# EasyEDA Pro project energymonitor_2025-05-27.epro, schematic Schematic_1, sheets 4 to 6 of 6

## Sheets
4 P4: Create Date: 2025-04-22; Page Name: P4; Update Date: 2025-04-23
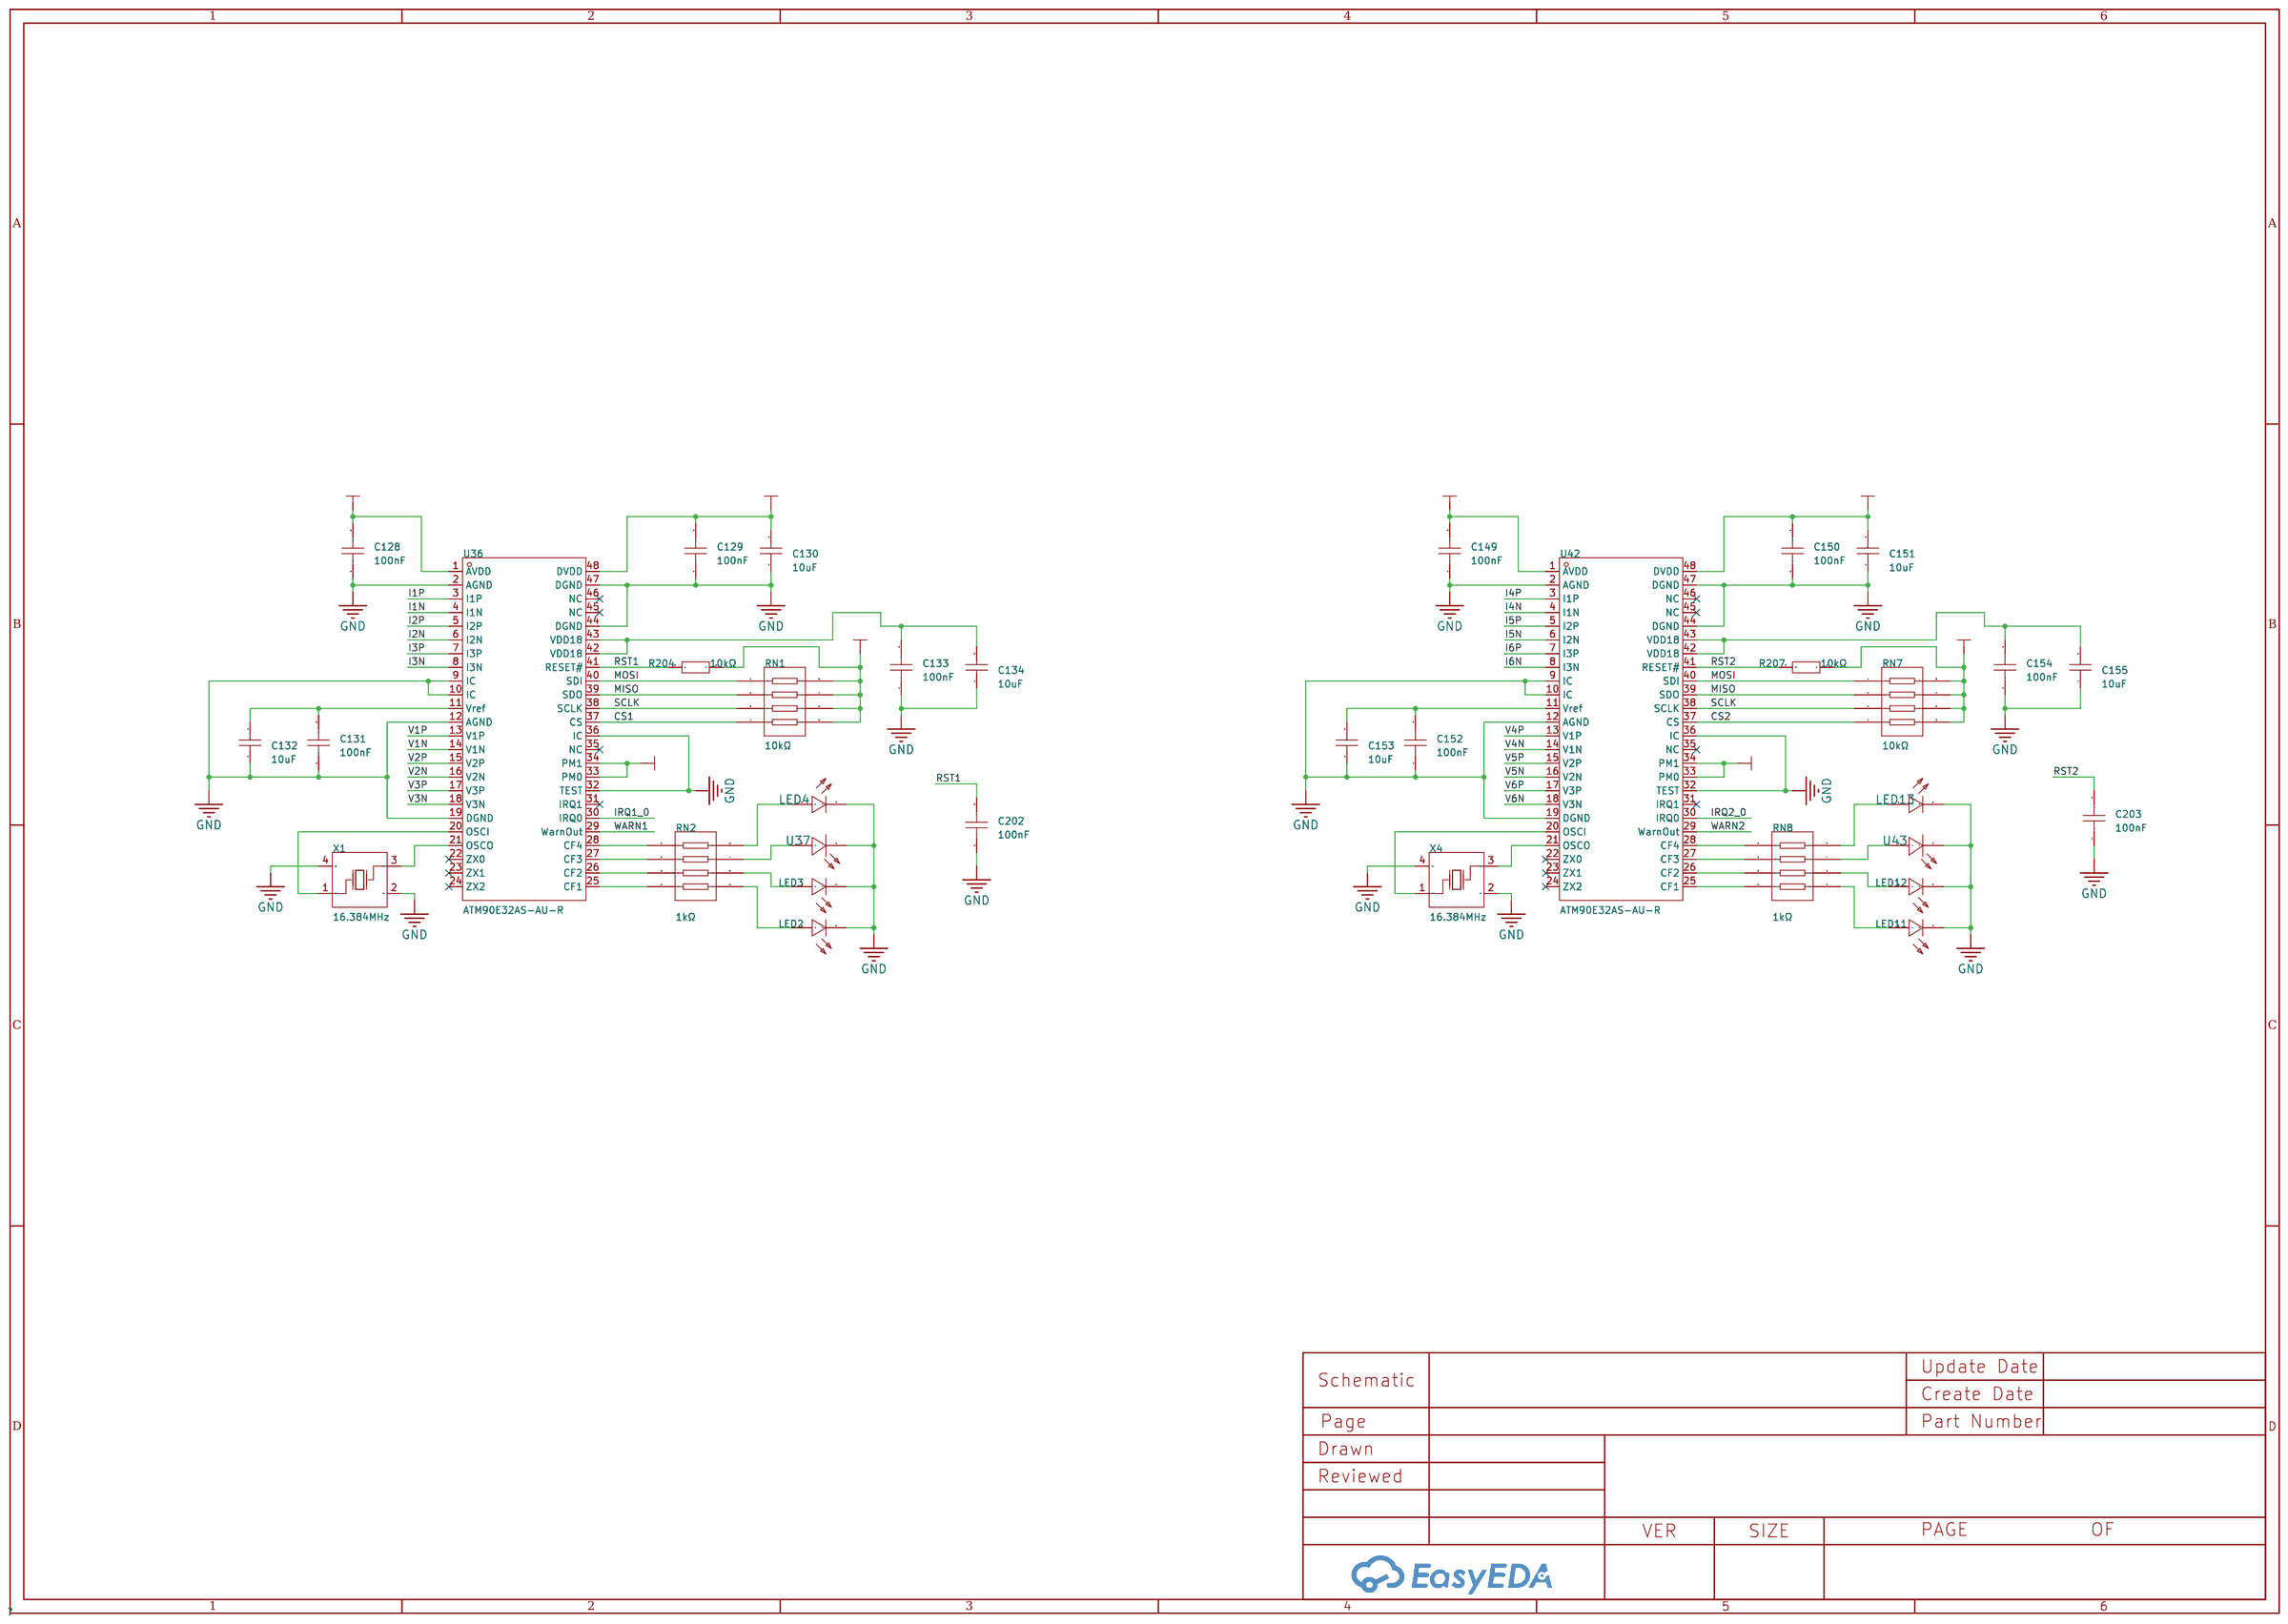
[diagram p3: P4]
5 P5: Create Date: 2025-04-22; Page Name: P5
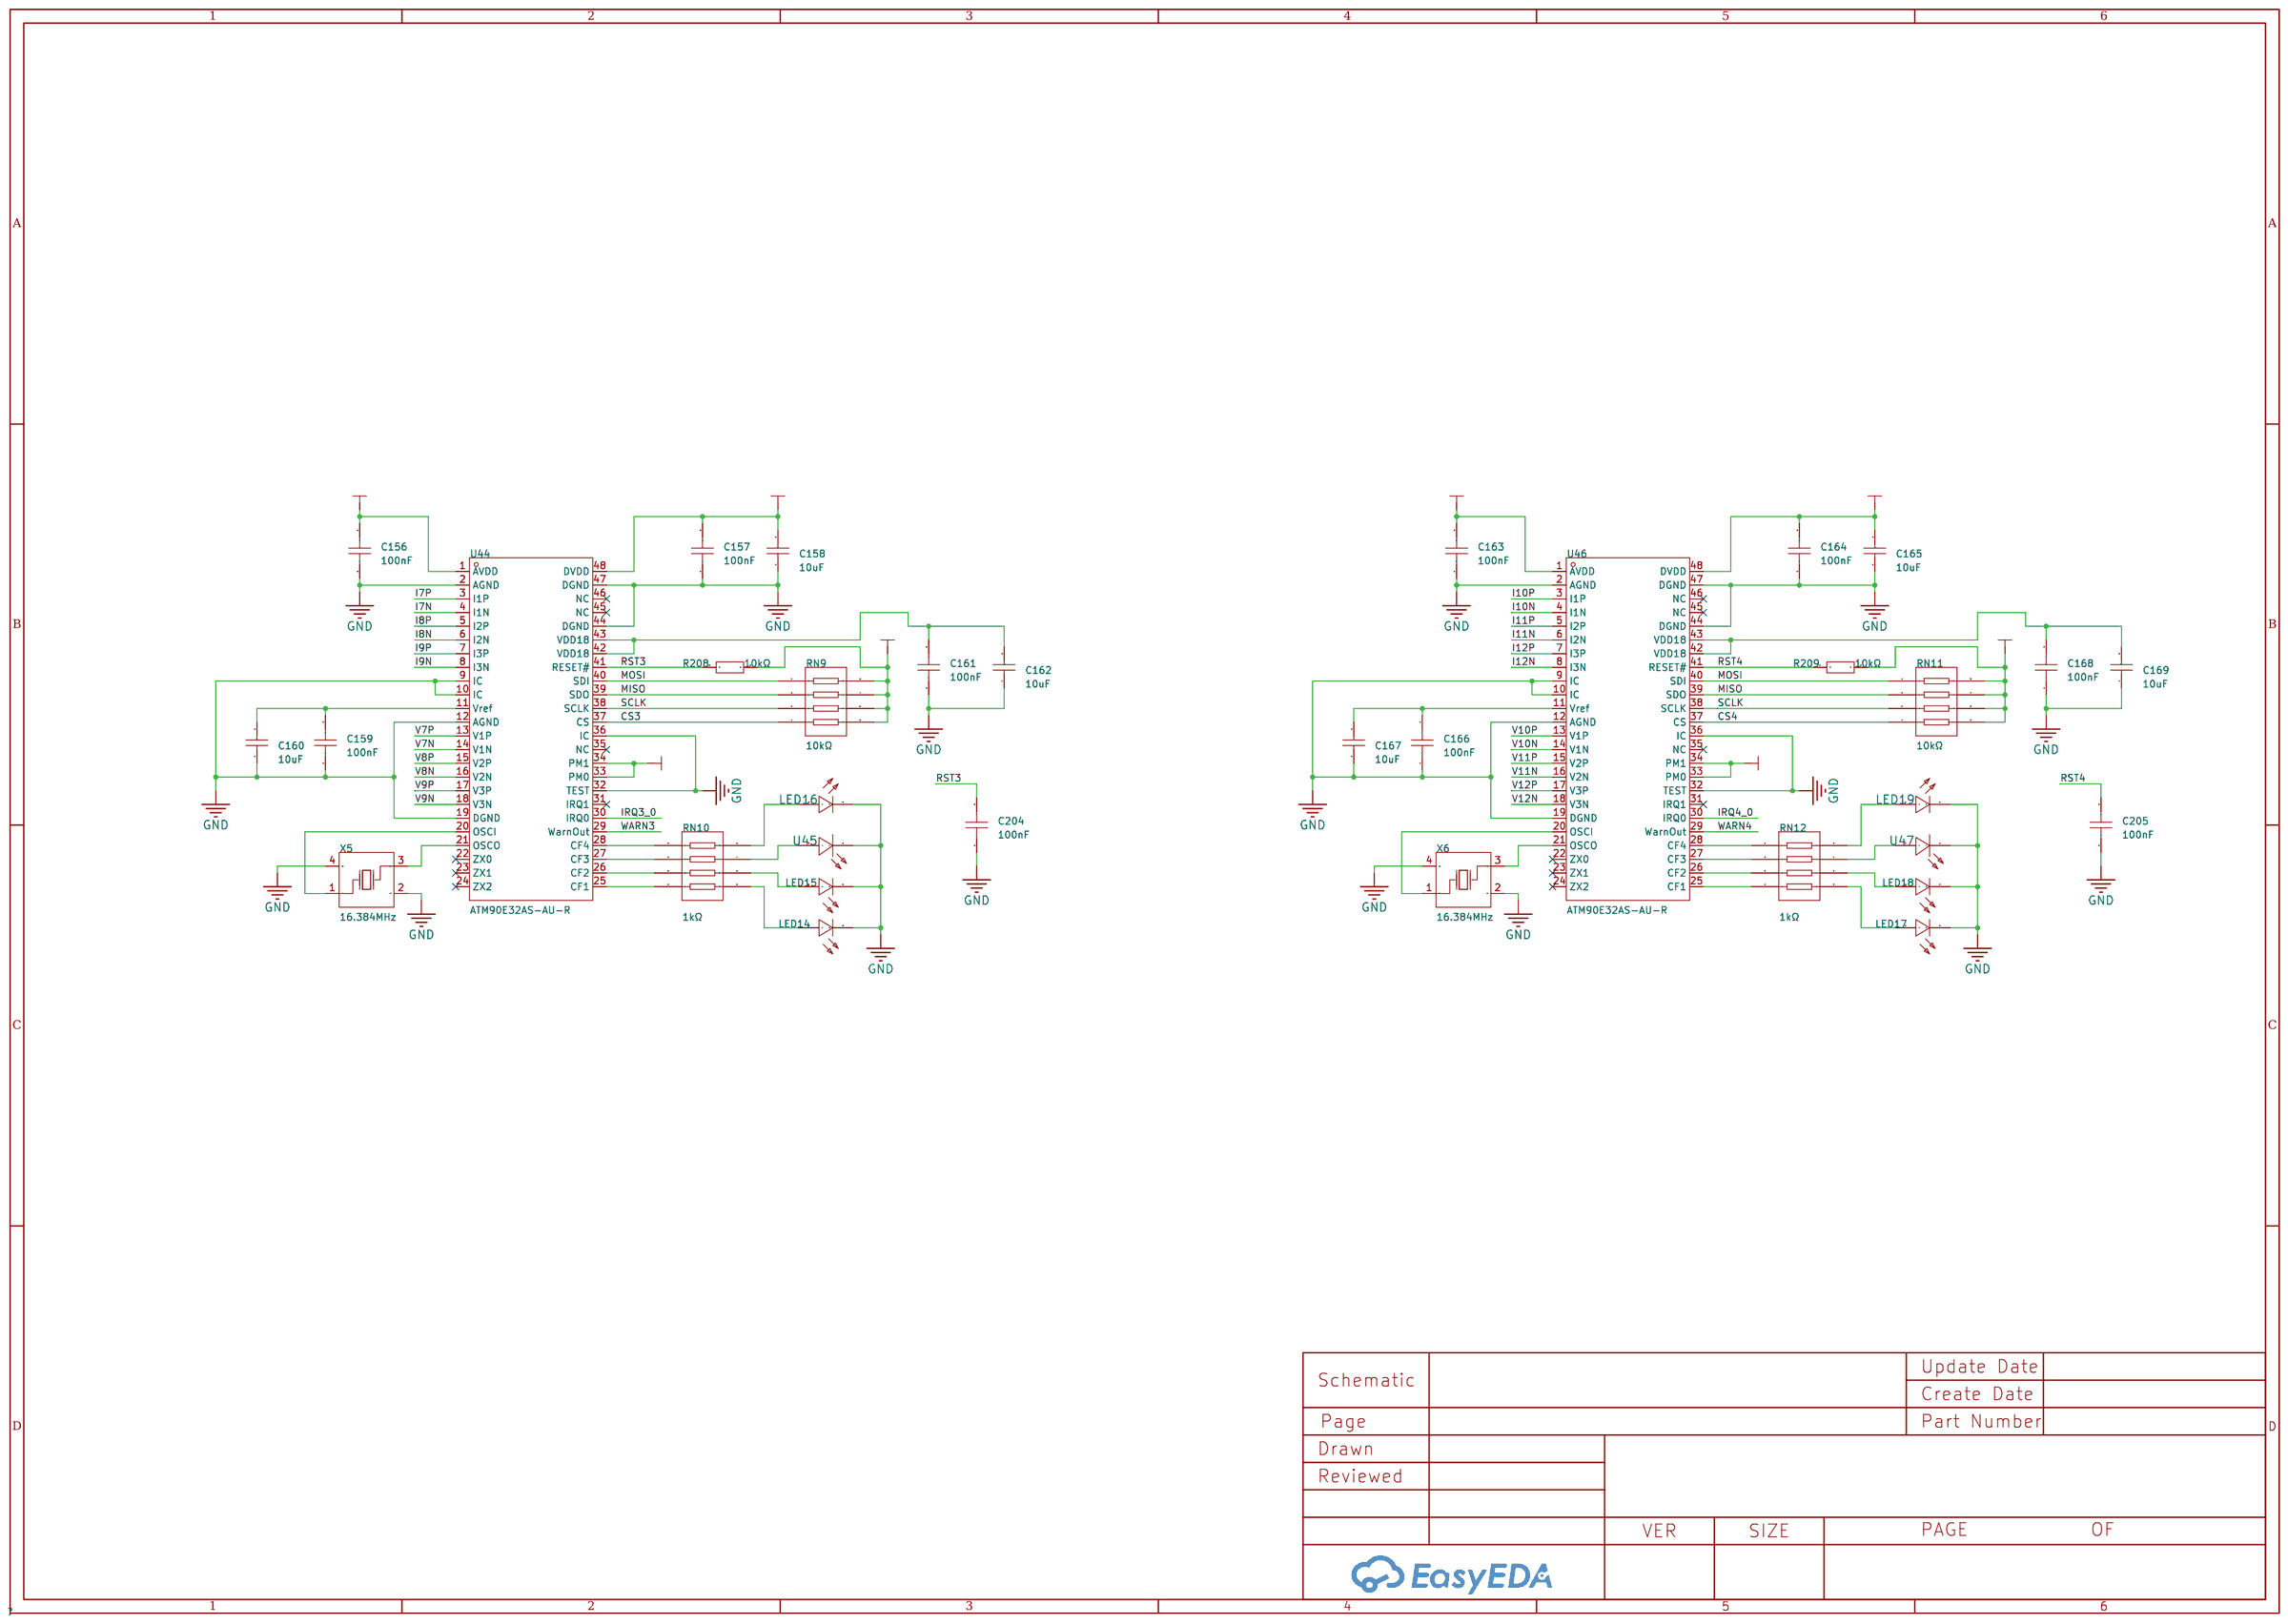
[diagram p4: P5]
6 P6: Create Date: 2025-04-23; Page Name: P6; Update Date: 2025-05-21
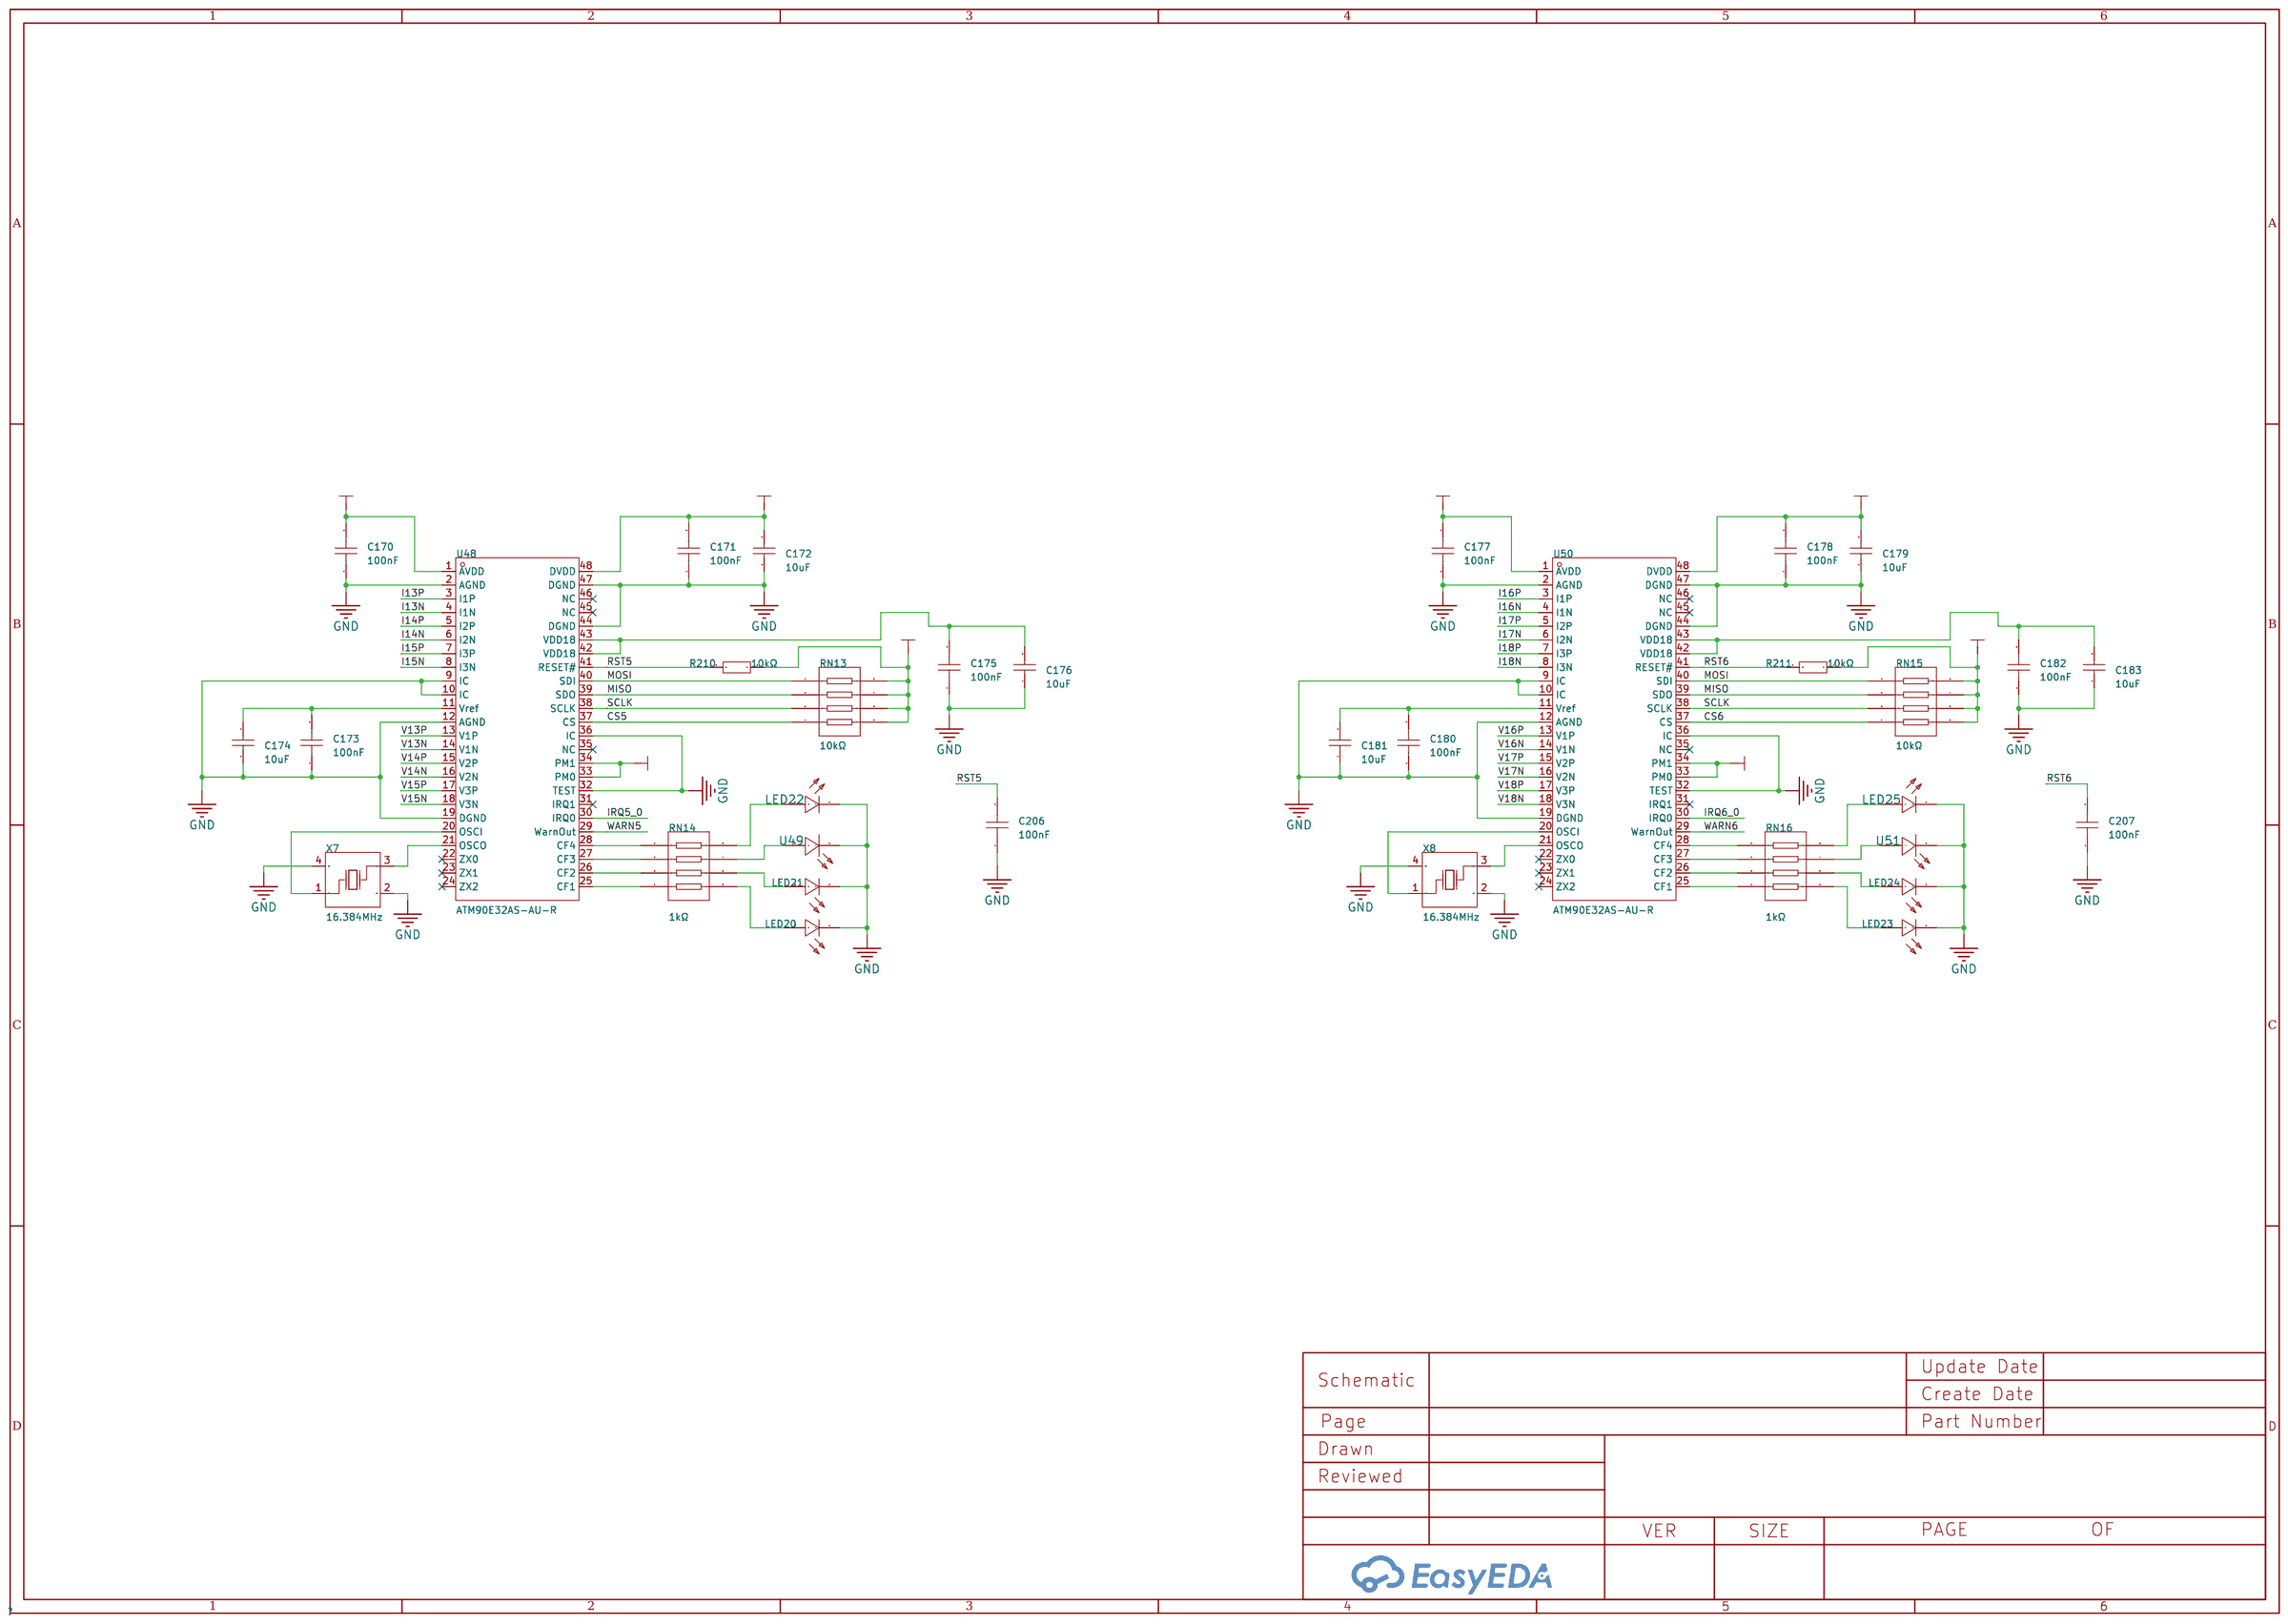
[diagram p5: P6]

## Parts
sheet P4
C128  100nF  [C0402]
C129  100nF  [C0402]
C130  10uF  [C0402]
C131  100nF  [C0402]
C132  10uF  [C0402]
C133  100nF  [C0402]
C134  10uF  [C0402]
C149  100nF  [C0402]
C150  100nF  [C0402]
C151  10uF  [C0402]
C152  100nF  [C0402]
C153  10uF  [C0402]
C154  100nF  [C0402]
C155  10uF  [C0402]
C202  100nF  [C0402]
C203  100nF  [C0402]
LED2  NCD0603R1  [LED0603-RD_RED]
LED3  NCD0603G1  [LED0603-RD_1]
LED4  NCD0603Y1  [LED0603-RD]
LED11  NCD0603R1  [LED0603-RD_RED]
LED12  NCD0603G1  [LED0603-RD_1]
LED13  NCD0603Y1  [LED0603-RD]
R204  10kΩ  [R0402]
R207  10kΩ  [R0402]
RN1  10kΩ  [RES-ARRAY-SMD_0603-8P-L3.2-W1.6-BL]
RN2  1kΩ  [RES-ARRAY-SMD_0603-8P-L3.2-W1.6-BL]
RN7  10kΩ  [RES-ARRAY-SMD_0603-8P-L3.2-W1.6-BL]
RN8  1kΩ  [RES-ARRAY-SMD_0603-8P-L3.2-W1.6-BL]
U36  ATM90E32AS-AU-R  [TQFP-48_L7.0-W7.0-P0.50-LS9.0-BL]
U37  NCD0603B5  [LED0603-RD]
U42  ATM90E32AS-AU-R  [TQFP-48_L7.0-W7.0-P0.50-LS9.0-BL]
U43  NCD0603B5  [LED0603-RD]
X1  16.384MHz  [CRYSTAL-SMD_4P-L3.2-W2.5-BL]
X4  16.384MHz  [CRYSTAL-SMD_4P-L3.2-W2.5-BL]
sheet P5
C156  100nF  [C0402]
C157  100nF  [C0402]
C158  10uF  [C0402]
C159  100nF  [C0402]
C160  10uF  [C0402]
C161  100nF  [C0402]
C162  10uF  [C0402]
C163  100nF  [C0402]
C164  100nF  [C0402]
C165  10uF  [C0402]
C166  100nF  [C0402]
C167  10uF  [C0402]
C168  100nF  [C0402]
C169  10uF  [C0402]
C204  100nF  [C0402]
C205  100nF  [C0402]
LED14  NCD0603R1  [LED0603-RD_RED]
LED15  NCD0603G1  [LED0603-RD_1]
LED16  NCD0603Y1  [LED0603-RD]
LED17  NCD0603R1  [LED0603-RD_RED]
LED18  NCD0603G1  [LED0603-RD_1]
LED19  NCD0603Y1  [LED0603-RD]
R208  10kΩ  [R0402]
R209  10kΩ  [R0402]
RN9  10kΩ  [RES-ARRAY-SMD_0603-8P-L3.2-W1.6-BL]
RN10  1kΩ  [RES-ARRAY-SMD_0603-8P-L3.2-W1.6-BL]
RN11  10kΩ  [RES-ARRAY-SMD_0603-8P-L3.2-W1.6-BL]
RN12  1kΩ  [RES-ARRAY-SMD_0603-8P-L3.2-W1.6-BL]
U44  ATM90E32AS-AU-R  [TQFP-48_L7.0-W7.0-P0.50-LS9.0-BL]
U45  NCD0603B5  [LED0603-RD]
U46  ATM90E32AS-AU-R  [TQFP-48_L7.0-W7.0-P0.50-LS9.0-BL]
U47  NCD0603B5  [LED0603-RD]
X5  16.384MHz  [CRYSTAL-SMD_4P-L3.2-W2.5-BL]
X6  16.384MHz  [CRYSTAL-SMD_4P-L3.2-W2.5-BL]
sheet P6
C170  100nF  [C0402]
C171  100nF  [C0402]
C172  10uF  [C0402]
C173  100nF  [C0402]
C174  10uF  [C0402]
C175  100nF  [C0402]
C176  10uF  [C0402]
C177  100nF  [C0402]
C178  100nF  [C0402]
C179  10uF  [C0402]
C180  100nF  [C0402]
C181  10uF  [C0402]
C182  100nF  [C0402]
C183  10uF  [C0402]
C206  100nF  [C0402]
C207  100nF  [C0402]
LED20  NCD0603R1  [LED0603-RD_RED]
LED21  NCD0603G1  [LED0603-RD_1]
LED22  NCD0603Y1  [LED0603-RD]
LED23  NCD0603R1  [LED0603-RD_RED]
LED24  NCD0603G1  [LED0603-RD_1]
LED25  NCD0603Y1  [LED0603-RD]
R210  10kΩ  [R0402]
R211  10kΩ  [R0402]
RN13  10kΩ  [RES-ARRAY-SMD_0603-8P-L3.2-W1.6-BL]
RN14  1kΩ  [RES-ARRAY-SMD_0603-8P-L3.2-W1.6-BL]
RN15  10kΩ  [RES-ARRAY-SMD_0603-8P-L3.2-W1.6-BL]
RN16  1kΩ  [RES-ARRAY-SMD_0603-8P-L3.2-W1.6-BL]
U48  ATM90E32AS-AU-R  [TQFP-48_L7.0-W7.0-P0.50-LS9.0-BL]
U49  NCD0603B5  [LED0603-RD]
U50  ATM90E32AS-AU-R  [TQFP-48_L7.0-W7.0-P0.50-LS9.0-BL]
U51  NCD0603B5  [LED0603-RD]
X7  16.384MHz  [CRYSTAL-SMD_4P-L3.2-W2.5-BL]
X8  16.384MHz  [CRYSTAL-SMD_4P-L3.2-W2.5-BL]

## Library data of the parts
C128 C129 C131 C133 C149 C150 C152 C154 C156 C157 C159 C161 C163 C164 C166 C168 C170 C171 C173 C175 C177 C178 C180 C182 C202-C207 = CC0402JRX7R7BB104: Capacitance: Tolerance:±5% Tolerance:±5% Voltage Rated: Temperature Coefficient:; LCSC Part Name: 100nF ±5% 16V; Supplier Part: C541464; Manufacturer: YAGEO(国巨); Supplier Footprint: 0402; JLCPCB Part Class: Extended Part; Datasheet: https://atta.szlcsc.com/upload/public/pdf/source/20200615/C541464_B57AABC9570B6B2CE091E735F96B12C0.pdf; Supplier: LCSC; Tolerance: ±5%
C130 C132 C134 C151 C153 C155 C158 C160 C162 C165 C167 C169 C172 C174 C176 C179 C181 C183 = CC0402MRX5R5BB106: Capacitance: Tolerance:±20% Tolerance:±20% Voltage Rated: Temperature Coefficient:; LCSC Part Name: 10uF ±20% 6.3V; Supplier Part: C105884; Manufacturer: YAGEO(国巨); Supplier Footprint: 0402; JLCPCB Part Class: Extended Part; Datasheet: https://atta.szlcsc.com/upload/public/pdf/source/20181008/C309506_01C87B2C86DBD1236B532041A9B60642.pdf; Supplier: LCSC; Tolerance: ±20%
LED2 LED11 LED14 LED17 LED20 LED23 = NCD0603R1_C84263: Lamp Holder Type:- Illumination Color:Red Voltage - Forward(Vf):1.6V~2.6V Voltage - Forward(Vf):1.6V~2.6V Power(Watts):65mW Forward Current:25mA Wavelength - Dominant:615nm~630nm Wavelength - Dominant:615nm~630nm Peak Wavelength:- Diode Configuration:Inde; Supplier Part: C84263; Manufacturer: 国星光电; Supplier Footprint: 0603; JLCPCB Part Class: Extended Part; Datasheet: https://atta.szlcsc.com/upload/public/pdf/source/20200820/C84263_DABC6A75E58F576973B407FDBA283D60.pdf; Supplier: LCSC; Illumination Color: Red; Voltage - Forward(Vf): 1.6V~2.6V; Power(Watts): 65mW; Forward Current: 25mA; Wavelength - Dominant: 615nm~630nm; Diode Configuration: Independent Diode; Luminous Intensity: 80mcd~220mcd; Viewing Angle: 130°; Operating Temperature: -30℃~+85℃
LED3 LED12 LED15 LED18 LED21 LED24 = NCD0603G1: Illumination Color:Emerald Voltage - Forward(Vf):2.6V~3.6V Voltage - Forward(Vf):2.6V~3.6V Power(Watts):72mW Forward Current:20mA Wavelength - Dominant:515nm~530nm Wavelength - Dominant:515nm~530nm Lens Color:- Luminous Intensity:330mcd~900mcd Luminous In; Supplier Part: C84267; Manufacturer: 国星光电; Supplier Footprint: 0603; JLCPCB Part Class: Extended Part; Datasheet: https://atta.szlcsc.com/upload/public/pdf/source/20200820/C84267_04BA7703640BAC111D09F5EFB971FBF3.pdf; Supplier: LCSC; Illumination Color: Emerald; Voltage - Forward(Vf): 2.6V~3.6V; Power(Watts): 72mW; Forward Current: 20mA; Wavelength - Dominant: 515nm~530nm; Luminous Intensity: 330mcd~900mcd; Viewing Angle: 130°; Operating Temperature: -30℃~+85℃
LED4 LED13 LED16 LED19 LED22 LED25 = NCD0603Y1: Emitted Color:Yellow Forward Voltage (VF):1.6V~2.6V Forward Voltage (VF):1.6V~2.6V Power Dissipation:65mW Forward Current:20mA Dominant Wavelength:586nm~595nm Dominant Wavelength:586nm~595nm Lens Color:无色透明透镜 Luminous Intensity:80mcd~220mcd Luminous Inten; Supplier Part: C84268; Manufacturer: 国星光电; Supplier Footprint: 0603; JLCPCB Part Class: Extended Part; Datasheet: https://atta.szlcsc.com/upload/public/pdf/source/20200820/C84268_8FC106CB292CF978F9CFC6892464F83C.pdf; Supplier: LCSC; Emitted Color: Yellow; Forward Voltage (VF): 1.6V~2.6V; Power Dissipation: 65mW; Forward Current: 20mA; Dominant Wavelength: 586nm~595nm; Lens Color: 无色透明透镜; Luminous Intensity: 80mcd~220mcd; Viewing Angle: 130°; Operating Temperature: -30℃~+85℃
R204 R207-R211 = RC0402FR-0710KL: Type:Thick Film Resistors Resistance: Tolerance:±1% Tolerance:±1% Power(Watts): Overload Voltage (Max): Temperature Coefficient:±100ppm/℃ Temperature Coefficient:±100ppm/℃ Operating Temperature Range:-55℃~+155℃ Operating Temperature Range:-55℃~+155℃; LCSC Part Name: 厚膜电阻 10kΩ ±1% 62.5mW; Supplier Part: C60490; Manufacturer: YAGEO(国巨); Supplier Footprint: 0402; JLCPCB Part Class: Extended Part; Datasheet: https://atta.szlcsc.com/upload/public/pdf/source/20170925/C131467_1506321478108990263.pdf; Supplier: LCSC; Type: Thick Film Resistors; Tolerance: ±1%; Temperature Coefficient: ±100ppm/℃; Operating Temperature Range: -55℃~+155℃
RN1 RN7 RN9 RN11 RN13 RN15 = YC164-JR-0710KL: Number of Resistors: Resistance:10kΩ Tolerance:±5% Tolerance:±5% Power(Watts):62.5mW Temperature Coefficient:±200ppm/℃ Temperature Coefficient:±200ppm/℃ Number of Pins:; LCSC Part Name: 10kΩ ±5% 四位贴片排阻; Supplier Part: C107374; Manufacturer: YAGEO(国巨); Supplier Footprint: 0603x4; JLCPCB Part Class: Extended Part; Datasheet: https://atta.szlcsc.com/upload/public/pdf/source/20170428/1493376791474.pdf; Supplier: LCSC; Tolerance: ±5%; Power(Watts): 62.5mW; Temperature Coefficient: ±200ppm/℃
RN2 RN8 RN10 RN12 RN14 RN16 = YC164-FR-071KL: Number of Resistors: Resistance: Tolerance:±1% Tolerance:±1% Power(Watts): Temperature Coefficient:±200ppm/℃ Temperature Coefficient:±200ppm/℃ Number of Pins:; LCSC Part Name: 1kΩ ±1%; Supplier Part: C110021; Manufacturer: YAGEO(国巨); Supplier Footprint: 0603x4; JLCPCB Part Class: Extended Part; Datasheet: https://atta.szlcsc.com/upload/public/pdf/source/20170428/1493376791474.pdf; Supplier: LCSC; Tolerance: ±1%; Temperature Coefficient: ±200ppm/℃
U36 U42 U44 U46 U48 U50 = ATM90E32AS-AU-R: Meter Type:Multiphase electricity chip Operating Voltage:2.8V~3.6V Operating Voltage:2.8V~3.6V Operating Current:13mA Operating Current:13mA Operating Temperature:-40℃~+85℃ Operating Temperature:-40℃~+85℃; LCSC Part Name: ATM90E32AS 增强型多相高性能宽动态范围电能计量IC; Supplier Part: C177153; Manufacturer: MICROCHIP(美国微芯); Supplier Footprint: TQFP-48(7x7); JLCPCB Part Class: Extended Part; Datasheet: https://atta.szlcsc.com/upload/public/pdf/source/20211126/A2E1337BD248096D2581FD4C83DD7FC4.pdf; Supplier: LCSC; Meter Type: Multiphase electricity chip; Operating Voltage: 2.8V~3.6V; Operating Current: 13mA; Operating Temperature: -40℃~+85℃
U37 U43 U45 U47 U49 U51 = NCD0603B5: Emitted Color:Blue Forward Voltage (VF):2.6V~3.6V Forward Voltage (VF):2.6V~3.6V Power Dissipation:72mW Forward Current:20mA Dominant Wavelength:466nm~478nm Dominant Wavelength:466nm~478nm Peak Wavelength:465nm Lens Color:无色透明透镜 Luminous Intensity:24mcd~8; Supplier Part: C7429915; Manufacturer: 国星光电; Supplier Footprint: 0603; JLCPCB Part Class: Extended Part; Datasheet: https://atta.szlcsc.com/upload/public/pdf/source/20230620/A99553C4827E027F77E56610B8942A11.pdf; Supplier: LCSC; Emitted Color: Blue; Forward Voltage (VF): 2.6V~3.6V; Power Dissipation: 72mW; Forward Current: 20mA; Dominant Wavelength: 466nm~478nm; Peak Wavelength: 465nm; Lens Color: 无色透明透镜; Luminous Intensity: 24mcd~80mcd; Viewing Angle: 140°; Operating Temperature: -30℃~+85℃
X1 X4-X8 = X322516384MSB4SI: Type:Surface Mount Crystal Frequency:16.384MHz Normal temperature Frequency Tolerance:±10ppm Normal temperature Frequency Tolerance:±10ppm Load Capacitance: Frequency Stability:±20ppm Frequency Stability:±20ppm Operating Temperature:-40℃~+85℃ Operating Te; LCSC Part Name: 16.384MHz ±10ppm 20pF; Supplier Part: C13739; Manufacturer: YXC(扬兴晶振); Supplier Footprint: SMD3225-4P; JLCPCB Part Class: Extended Part; Datasheet: https://atta.szlcsc.com/upload/public/pdf/source/20240329/19D5F850207469550BEB00D7DFEDBC7A.pdf; Supplier: LCSC; Type: Surface Mount Crystal; Normal temperature Frequency Tolerance: ±10ppm; Frequency Stability: ±20ppm; Operating Temperature: -40℃~+85℃

## Nets
3V3: C128.2 C129.2 C130.2 C149.2 C150.2 C151.2 C156.2 C157.2 C158.2 C163.2 C164.2 C165.2 C170.2 C171.2 C172.2 C177.2 C178.2 C179.2 R204.1 R207.1 R208.1 R209.1 R210.1 R211.1 RN1.5 RN1.6 RN1.7 RN1.8 RN7.5 RN7.6 RN7.7 RN7.8 RN9.5 RN9.6 RN9.7 RN9.8 RN11.5 RN11.6 RN11.7 RN11.8 RN13.5 RN13.6 RN13.7 RN13.8 RN15.5 RN15.6 RN15.7 RN15.8 U36.1(AVDD) U36.33(PM0) U36.34(PM1) U36.48(DVDD) U42.1(AVDD) U42.33(PM0) U42.34(PM1) U42.48(DVDD) U44.1(AVDD) U44.33(PM0) U44.34(PM1) U44.48(DVDD) U46.1(AVDD) U46.33(PM0) U46.34(PM1) U46.48(DVDD) U48.1(AVDD) U48.33(PM0) U48.34(PM1) U48.48(DVDD) U50.1(AVDD) U50.33(PM0) U50.34(PM1) U50.48(DVDD) ; also on sheet 1
GND: C128.1 C129.1 C130.1 C131.1 C132.1 C133.1 C134.1 C149.1 C150.1 C151.1 C152.1 C153.1 C154.1 C155.1 C156.1 C157.1 C158.1 C159.1 C160.1 C161.1 C162.1 C163.1 C164.1 C165.1 C166.1 C167.1 C168.1 C169.1 C170.1 C171.1 C172.1 C173.1 C174.1 C175.1 C176.1 C177.1 C178.1 C179.1 C180.1 C181.1 C182.1 C183.1 C202.1 C203.1 C204.1 C205.1 C206.1 C207.1 LED2.1(K) LED3.1(K) LED4.1(K) LED11.1(K) LED12.1(K) LED13.1(K) LED14.1(K) LED15.1(K) LED16.1(K) LED17.1(K) LED18.1(K) LED19.1(K) LED20.1(K) LED21.1(K) LED22.1(K) LED23.1(K) LED24.1(K) LED25.1(K) U36.2(AGND) U36.9(IC) U36.10(IC) U36.12(AGND) U36.19(DGND) U36.32(TEST) U36.36(IC) U36.44(DGND) U36.47(DGND) U37.1(-) U42.2(AGND) U42.9(IC) U42.10(IC) U42.12(AGND) U42.19(DGND) U42.32(TEST) U42.36(IC) U42.44(DGND) U42.47(DGND) U43.1(-) U44.2(AGND) U44.9(IC) U44.10(IC) U44.12(AGND) U44.19(DGND) U44.32(TEST) U44.36(IC) U44.44(DGND) U44.47(DGND) U45.1(-) U46.2(AGND) U46.9(IC) U46.10(IC) U46.12(AGND) U46.19(DGND) U46.32(TEST) U46.36(IC) U46.44(DGND) U46.47(DGND) U47.1(-) U48.2(AGND) U48.9(IC) U48.10(IC) U48.12(AGND) U48.19(DGND) U48.32(TEST) U48.36(IC) U48.44(DGND) U48.47(DGND) U49.1(-) U50.2(AGND) U50.9(IC) U50.10(IC) U50.12(AGND) U50.19(DGND) U50.32(TEST) U50.36(IC) U50.44(DGND) U50.47(DGND) U51.1(-) X1.2(GND) X1.4(GND) X4.2(GND) X4.4(GND) X5.2(GND) X5.4(GND) X6.2(GND) X6.4(GND) X7.2(GND) X7.4(GND) X8.2(GND) X8.4(GND) ; also on sheet 1 2 3
V1N: U36.14(V1N) ; also on sheet 3
V1P: U36.13(V1P) ; also on sheet 3
V2N: U36.16(V2N) ; also on sheet 3
V2P: U36.15(V2P) ; also on sheet 3
V3N: U36.18(V3N) ; also on sheet 3
V3P: U36.17(V3P) ; also on sheet 3
V4N: U42.14(V1N) ; also on sheet 3
V4P: U42.13(V1P) ; also on sheet 3
V5N: U42.16(V2N) ; also on sheet 3
V5P: U42.15(V2P) ; also on sheet 3
V6N: U42.18(V3N) ; also on sheet 3
V6P: U42.17(V3P) ; also on sheet 3
V7N: U44.14(V1N) ; also on sheet 3
V7P: U44.13(V1P) ; also on sheet 3
V8N: U44.16(V2N) ; also on sheet 3
V8P: U44.15(V2P) ; also on sheet 3
V9N: U44.18(V3N) ; also on sheet 3
V9P: U44.17(V3P) ; also on sheet 3
V10N: U46.14(V1N) ; also on sheet 3
V10P: U46.13(V1P) ; also on sheet 3
V11N: U46.16(V2N) ; also on sheet 3
V11P: U46.15(V2P) ; also on sheet 3
V12N: U46.18(V3N) ; also on sheet 3
V12P: U46.17(V3P) ; also on sheet 3
V13N: U48.14(V1N) ; also on sheet 3
V13P: U48.13(V1P) ; also on sheet 3
V14N: U48.16(V2N) ; also on sheet 3
V14P: U48.15(V2P) ; also on sheet 3
V15N: U48.18(V3N) ; also on sheet 3
V15P: U48.17(V3P) ; also on sheet 3
V16N: U50.14(V1N) ; also on sheet 3
V16P: U50.13(V1P) ; also on sheet 3
V17N: U50.16(V2N) ; also on sheet 3
V17P: U50.15(V2P) ; also on sheet 3
V18N: U50.18(V3N) ; also on sheet 3
V18P: U50.17(V3P) ; also on sheet 3
CS1: RN1.4 U36.37(CS) ; also on sheet 1
CS2: RN7.4 U42.37(CS) ; also on sheet 1
CS3: RN9.4 U44.37(CS) ; also on sheet 1
CS4: RN11.4 U46.37(CS) ; also on sheet 1
CS5: RN13.4 U48.37(CS) ; also on sheet 1
CS6: RN15.4 U50.37(CS) ; also on sheet 1
I1N: U36.4(I1N) ; also on sheet 2
I1P: U36.3(I1P) ; also on sheet 2
I2N: U36.6(I2N) ; also on sheet 2
I2P: U36.5(I2P) ; also on sheet 2
I3N: U36.8(I3N) ; also on sheet 2
I3P: U36.7(I3P) ; also on sheet 2
I4N: U42.4(I1N) ; also on sheet 2
I4P: U42.3(I1P) ; also on sheet 2
I5N: U42.6(I2N) ; also on sheet 2
I5P: U42.5(I2P) ; also on sheet 2
I6N: U42.8(I3N) ; also on sheet 2
I6P: U42.7(I3P) ; also on sheet 2
I7N: U44.4(I1N) ; also on sheet 2
I7P: U44.3(I1P) ; also on sheet 2
I8N: U44.6(I2N) ; also on sheet 2
I8P: U44.5(I2P) ; also on sheet 2
I9N: U44.8(I3N) ; also on sheet 2
I9P: U44.7(I3P) ; also on sheet 2
I10N: U46.4(I1N) ; also on sheet 2
I10P: U46.3(I1P) ; also on sheet 2
I11N: U46.6(I2N) ; also on sheet 2
I11P: U46.5(I2P) ; also on sheet 2
I12N: U46.8(I3N) ; also on sheet 2
I12P: U46.7(I3P) ; also on sheet 2
I13N: U48.4(I1N) ; also on sheet 2
I13P: U48.3(I1P) ; also on sheet 2
I14N: U48.6(I2N) ; also on sheet 2
I14P: U48.5(I2P) ; also on sheet 2
I15N: U48.8(I3N) ; also on sheet 2
I15P: U48.7(I3P) ; also on sheet 2
I16N: U50.4(I1N) ; also on sheet 2
I16P: U50.3(I1P) ; also on sheet 2
I17N: U50.6(I2N) ; also on sheet 2
I17P: U50.5(I2P) ; also on sheet 2
I18N: U50.8(I3N) ; also on sheet 2
I18P: U50.7(I3P) ; also on sheet 2
IRQ1_0: U36.30(IRQ0) ; also on sheet 1
IRQ2_0: U42.30(IRQ0) ; also on sheet 1
IRQ3_0: U44.30(IRQ0) ; also on sheet 1
IRQ4_0: U46.30(IRQ0) ; also on sheet 1
IRQ5_0: U48.30(IRQ0) ; also on sheet 1
IRQ6_0: U50.30(IRQ0) ; also on sheet 1
MISO: RN1.2 RN7.2 RN9.2 RN11.2 RN13.2 RN15.2 U36.39(SDO) U42.39(SDO) U44.39(SDO) U46.39(SDO) U48.39(SDO) U50.39(SDO) ; also on sheet 1
MOSI: RN1.1 RN7.1 RN9.1 RN11.1 RN13.1 RN15.1 U36.40(SDI) U42.40(SDI) U44.40(SDI) U46.40(SDI) U48.40(SDI) U50.40(SDI) ; also on sheet 1
RST1: C202.2 R204.2 U36.41(RESET#)
RST2: C203.2 R207.2 U42.41(RESET#)
RST3: C204.2 R208.2 U44.41(RESET#)
RST4: C205.2 R209.2 U46.41(RESET#)
RST5: C206.2 R210.2 U48.41(RESET#)
RST6: C207.2 R211.2 U50.41(RESET#)
SCLK: RN1.3 RN7.3 RN9.3 RN11.3 RN13.3 RN15.3 U36.38(SCLK) U42.38(SCLK) U44.38(SCLK) U46.38(SCLK) U48.38(SCLK) U50.38(SCLK) ; also on sheet 1
WARN1: U36.29(WarnOut) ; also on sheet 1
WARN2: U42.29(WarnOut) ; also on sheet 1
WARN3: U44.29(WarnOut) ; also on sheet 1
WARN4: U46.29(WarnOut) ; also on sheet 1
WARN5: U48.29(WarnOut) ; also on sheet 1
WARN6: U50.29(WarnOut) ; also on sheet 1
$4N7519: C131.2 C132.2 U36.11(Vref)
$4N7542: U36.21(OSCO) X1.3(OSC2)
$4N7546: U36.20(OSCI) X1.1(OSC1)
$4N7556: RN2.1 U36.28(CF4)
$4N7558: RN2.2 U36.27(CF3)
$4N7560: RN2.3 U36.26(CF2)
$4N7562: RN2.4 U36.25(CF1)
$4N7564: LED2.2(A) RN2.5
$4N7568: LED3.2(A) RN2.6
$4N7572: RN2.7 U37.2(+)
$4N7576: LED4.2(A) RN2.8
$4N7637: C133.2 C134.2 U36.42(VDD18) U36.43(VDD18)
$4N8632: C152.2 C153.2 U42.11(Vref)
$4N8655: U42.21(OSCO) X4.3(OSC2)
$4N8659: U42.20(OSCI) X4.1(OSC1)
$4N8669: RN8.1 U42.28(CF4)
$4N8671: RN8.2 U42.27(CF3)
$4N8673: RN8.3 U42.26(CF2)
$4N8675: RN8.4 U42.25(CF1)
$4N8677: LED11.2(A) RN8.5
$4N8681: LED12.2(A) RN8.6
$4N8685: RN8.7 U43.2(+)
$4N8689: LED13.2(A) RN8.8
$4N8750: C154.2 C155.2 U42.42(VDD18) U42.43(VDD18)
$5N3495: C159.2 C160.2 U44.11(Vref)
$5N3518: U44.21(OSCO) X5.3(OSC2)
$5N3522: U44.20(OSCI) X5.1(OSC1)
$5N3532: RN10.1 U44.28(CF4)
$5N3534: RN10.2 U44.27(CF3)
$5N3536: RN10.3 U44.26(CF2)
$5N3538: RN10.4 U44.25(CF1)
$5N3540: LED14.2(A) RN10.5
$5N3544: LED15.2(A) RN10.6
$5N3548: RN10.7 U45.2(+)
$5N3552: LED16.2(A) RN10.8
$5N3613: C161.2 C162.2 U44.42(VDD18) U44.43(VDD18)
$5N3691: C166.2 C167.2 U46.11(Vref)
$5N3714: U46.21(OSCO) X6.3(OSC2)
$5N3718: U46.20(OSCI) X6.1(OSC1)
$5N3728: RN12.1 U46.28(CF4)
$5N3730: RN12.2 U46.27(CF3)
$5N3732: RN12.3 U46.26(CF2)
$5N3734: RN12.4 U46.25(CF1)
$5N3736: LED17.2(A) RN12.5
$5N3740: LED18.2(A) RN12.6
$5N3744: RN12.7 U47.2(+)
$5N3748: LED19.2(A) RN12.8
$5N3809: C168.2 C169.2 U46.42(VDD18) U46.43(VDD18)
$6N1915: C173.2 C174.2 U48.11(Vref)
$6N1938: U48.21(OSCO) X7.3(OSC2)
$6N1942: U48.20(OSCI) X7.1(OSC1)
$6N1952: RN14.1 U48.28(CF4)
$6N1954: RN14.2 U48.27(CF3)
$6N1956: RN14.3 U48.26(CF2)
$6N1958: RN14.4 U48.25(CF1)
$6N1960: LED20.2(A) RN14.5
$6N1964: LED21.2(A) RN14.6
$6N1968: RN14.7 U49.2(+)
$6N1972: LED22.2(A) RN14.8
$6N2033: C175.2 C176.2 U48.42(VDD18) U48.43(VDD18)
$6N2111: C180.2 C181.2 U50.11(Vref)
$6N2134: U50.21(OSCO) X8.3(OSC2)
$6N2138: U50.20(OSCI) X8.1(OSC1)
$6N2148: RN16.1 U50.28(CF4)
$6N2150: RN16.2 U50.27(CF3)
$6N2152: RN16.3 U50.26(CF2)
$6N2154: RN16.4 U50.25(CF1)
$6N2156: LED23.2(A) RN16.5
$6N2160: LED24.2(A) RN16.6
$6N2164: RN16.7 U51.2(+)
$6N2168: LED25.2(A) RN16.8
$6N2229: C182.2 C183.2 U50.42(VDD18) U50.43(VDD18)

Not connected (* = marked no-connect by the designer): U36 22(ZX0)* 23(ZX1)* 24(ZX2)* 31(IRQ1)* 35(NC)* 45(NC)* 46(NC)*; U42 22(ZX0)* 23(ZX1)* 24(ZX2)* 31(IRQ1)* 35(NC)* 45(NC)* 46(NC)*; U44 22(ZX0)* 23(ZX1)* 24(ZX2)* 31(IRQ1)* 35(NC)* 45(NC)* 46(NC)*; U46 22(ZX0)* 23(ZX1)* 24(ZX2)* 31(IRQ1)* 35(NC)* 45(NC)* 46(NC)*; U48 22(ZX0)* 23(ZX1)* 24(ZX2)* 31(IRQ1)* 35(NC)* 45(NC)* 46(NC)*; U50 22(ZX0)* 23(ZX1)* 24(ZX2)* 31(IRQ1)* 35(NC)* 45(NC)* 46(NC)*
